# Altium schematic sheet Sheet1.SchDoc (part 3 of 3)
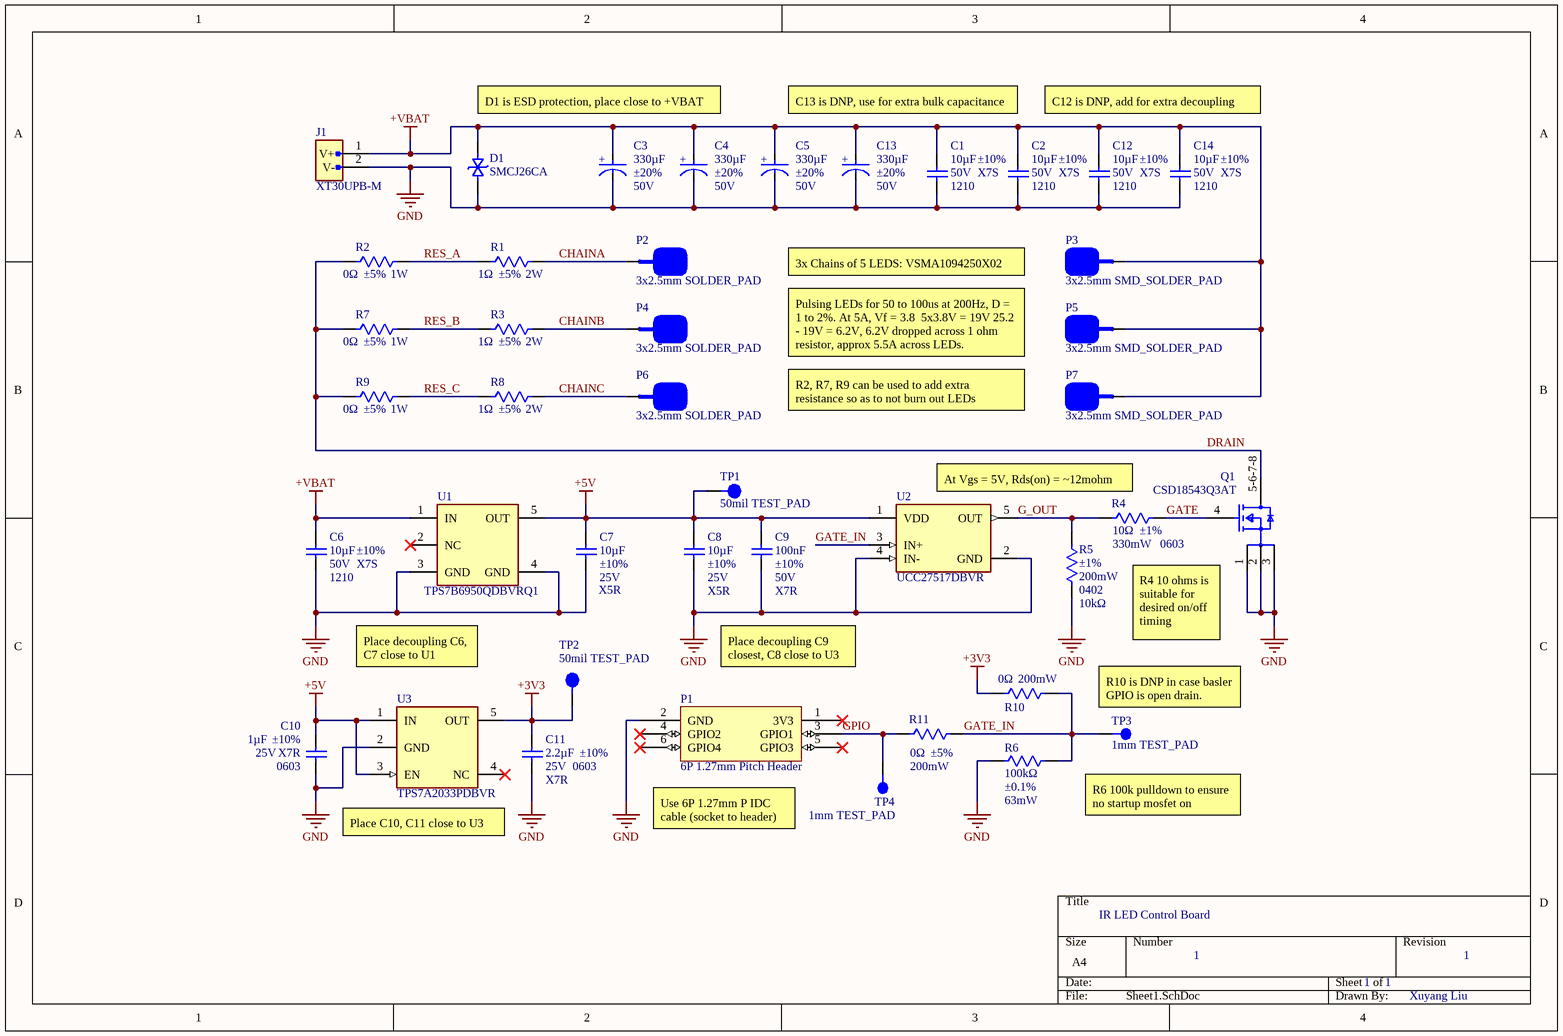
[diagram p2: Sheet1.SchDoc]

## Library data of the parts (continued)
R6 = RT0402BRD07100KL: 100kΩ 62.5mW Thin Film Resistor ±25ppm/℃ ±0.1% 100kΩ 0402 Chip Resistor - Surface Mount ROHS; Manufacturer: Yageo Group; Temperature Coefficient: 25ppm/°C; Voltage Rating: 50V; Manufacturer Part Number: RT0402BRD07100KL; RoHS: Compliant; Category: Chip SMD Resistors; Stock 1: 176013; Pricing 1: 1=0.1, 10=0.078, 25=0.0724, 50=0.0684, 100=0.0646, 250=0.05992, 500=0.05672, 1000=0.05377, 5000=0.04796 (USD); China RoHS: Non-Compliant; Composition: Thin Film; Country of Origin: Mainland China; Depth: 500µm; Export Control Classification Number (ECCN) Code: EAR99; Features: Moisture Resistant; Height: 300µm; Harmonized Tariff Schedule (HTS) Code: 8533.21.00.30; Introduction Date: 2008-06-09; Lead Free: Lead Free; Length: 1mm; Lifecycle Status: Production; Max Operating Temperature: 155°C; Military Standard: Not; Min Operating Temperature: -55°C; Mount: Surface Mount; Number of Terminals: 2; Number of Terminations: 2; Power Rating: 62.5mW; REACH SVHC: Yes; Schedule B: 8533210045, 8533210045|8533210045|8533210045|8533210045|8533210045; Termination: SMD/SMT; Voltage Rating (DC): 50V; Width: 500µm; Working Voltage: 50V; ComponentLink1URL: https://datasheet.octopart.com:443/RT0402BRD07100KL-Yageo-datasheet-176402239.pdf?src-supplier=Future+Electronics; ComponentLink1Description: https://datasheet.octopart.com:443/RT0402BRD07100KL-Yageo-datasheet-176402239.pdf?src-supplier=Future+Electronics; ComponentLink2URL: https://datasheet.octopart.com:443/RT0402BRD07100KL-Yageo-datasheet-169971040.pdf?src-supplier=Future+Electronics; ComponentLink2Description: https://datasheet.octopart.com:443/RT0402BRD07100KL-Yageo-datasheet-169971040.pdf?src-supplier=Future+Electronics; ComponentLink3URL: https://datasheet.octopart.com:443/RT0402BRD07100KL-Yageo-datasheet-166250672.pdf?src-supplier=Future+Electronics; ComponentLink3Description: https://datasheet.octopart.com:443/RT0402BRD07100KL-Yageo-datasheet-166250672.pdf?src-supplier=Future+Electronics; ComponentLink4URL: https://datasheet.octopart.com:443/RT0402BRD07100KL-Yageo-datasheet-136673517.pdf?src-supplier=Future+Electronics; ComponentLink4Description: https://datasheet.octopart.com:443/RT0402BRD07100KL-Yageo-datasheet-136673517.pdf?src-supplier=Future+Electronics; ComponentLink5URL: https://datasheet.octopart.com:443/RT0402BRD07100KL-Yageo-datasheet-137700930.pdf?src-supplier=Future+Electronics; ComponentLink5Description: https://datasheet.octopart.com:443/RT0402BRD07100KL-Yageo-datasheet-137700930.pdf?src-supplier=Future+Electronics; ComponentLink6URL: https://datasheet.octopart.com:443/RT0402BRD07100KL-Yageo-datasheet-41589729.pdf?src-supplier=Future+Electronics; ComponentLink6Description: https://datasheet.octopart.com:443/RT0402BRD07100KL-Yageo-datasheet-41589729.pdf?src-supplier=Future+Electronics; ComponentLink7URL: https://datasheet.octopart.com:443/RT0402BRD07100KL-Yageo-datasheet-12594463.pdf?src-supplier=Future+Electronics; ComponentLink7Description: https://datasheet.octopart.com:443/RT0402BRD07100KL-Yageo-datasheet-12594463.pdf?src-supplier=Future+Electronics; ComponentLink8URL: https://datasheet.octopart.com:443/RT0402BRD07100KL-Yageo-datasheet-10915759.pdf?src-supplier=Future+Electronics; ComponentLink8Description: https://datasheet.octopart.com:443/RT0402BRD07100KL-Yageo-datasheet-10915759.pdf?src-supplier=Future+Electronics; ComponentLink9URL: https://datasheet.octopart.com:443/RT0402BRD07100KL-Yageo-datasheet-34924148.pdf?src-supplier=Future+Electronics; ComponentLink9Description: https://datasheet.octopart.com:443/RT0402BRD07100KL-Yageo-datasheet-34924148.pdf?src-supplier=Future+Electronics; ComponentLink10URL: https://datasheet.octopart.com:443/RT0402BRD07100KL-Yageo-datasheet-96443642.pdf?src-supplier=Upverter; ComponentLink10Description: https://datasheet.octopart.com:443/RT0402BRD07100KL-Yageo-datasheet-96443642.pdf?src-supplier=Upverter; ComponentLink11URL: https://datasheet.octopart.com:443/RT0402BRD07100KL-Yageo-Group-datasheet-188167888.pdf?src-supplier=LCSC; ComponentLink11Description: https://datasheet.octopart.com:443/RT0402BRD07100KL-Yageo-Group-datasheet-188167888.pdf?src-supplier=LCSC; ComponentLink12URL: https://datasheet.octopart.com:443/RT0402BRD07100KL-Yageo-datasheet-164439670.pdf?src-supplier=Newark; ComponentLink12Description: https://datasheet.octopart.com:443/RT0402BRD07100KL-Yageo-datasheet-164439670.pdf?src-supplier=Newark; ComponentLink13URL: https://datasheet.octopart.com:443/RT0402BRD07100KL-Yageo-Group-datasheet-141265893.pdf?src-supplier=ODG+(Origin+Data+Global); ComponentLink13Description: https://datasheet.octopart.com:443/RT0402BRD07100KL-Yageo-Group-datasheet-141265893.pdf?src-supplier=ODG+(Origin+Data+Global); ComponentLink14URL: https://datasheet.octopart.com/RT0402BRD07100KL-Yageo-datasheet-86813807.pdf; ComponentLink14Description: https://datasheet.octopart.com/RT0402BRD07100KL-Yageo-datasheet-86813807.pdf; ComponentLink15URL: http://sigma.octopart.com:80/conflict_mineral_statement/Yageo-company-3.pdf?src-supplier=Compliance+Statements; ComponentLink15Description: http://sigma.octopart.com:80/conflict_mineral_statement/Yageo-company-3.pdf?src-supplier=Compliance+Statements; ComponentLink16URL: http://sigma.octopart.com:80/rohs_statement/Yageo-company-2.pdf?src-supplier=Compliance+Statements; ComponentLink16Description: http://sigma.octopart.com:80/rohs_statement/Yageo-company-2.pdf?src-supplier=Compliance+Statements; Supplier Part Number 1: YAG1343CT-ND; Supplier 1: DigiKey; Case/Package: 0402; Case Code (Imperial): 0402
R10 = RCS04020000Z0ED: 0Ω Resistor, Jumper, 0402 [1005 Metric], Thick Film, 200 mW, 3 A, Surface Mount Device; Manufacturer: Vishay; Max Current Rating: 3A; Voltage Rating: 50V; Tolerance: ±5%; Supplier 1: DigiKey; Manufacturer Part Number: RCS04020000Z0ED; RoHS: Compliant; Category: Chip SMD Resistors; Stock 1: 775160; Pricing 1: 1=0.1, 10=0.032, 25=0.0268, 50=0.0232, 100=0.0204, 250=0.01728, 500=0.01532, 1000=0.01364, 5000=0.01064 (USD); Case Code (Imperial): 0402; Case Code (Metric): 1005; China RoHS: Non-Compliant; Composition: Thick Film; Country of Origin: Israel, Mainland China; Export Control Classification Number (ECCN) Code: EAR99; Features: Automotive AEC-Q200; Height: 350µm; Harmonized Tariff Schedule (HTS) Code: 8533.21.00.30; Introduction Date: 2016-07-12; Length: 1mm; Lifecycle Status: Production; Max Operating Temperature: 155°C; Max Power Dissipation: 200mW; Min Operating Temperature: -55°C; Mount: Surface Mount; Number of Terminals: 2; Number of Terminations: 2; Ratings: AEC-Q200; REACH SVHC: Yes; Voltage Rating (DC): 50V; Width: 500µm; ComponentLink1URL: https://datasheet.octopart.com:443/RCS04020000Z0ED-Vishay-datasheet-176436275.pdf?src-supplier=IHS; ComponentLink1Description: https://datasheet.octopart.com:443/RCS04020000Z0ED-Vishay-datasheet-176436275.pdf?src-supplier=IHS; ComponentLink2URL: https://datasheet.octopart.com:443/RCS04020000Z0ED-Vishay-datasheet-86813749.pdf?src-supplier=Future+Electronics; ComponentLink2Description: https://datasheet.octopart.com:443/RCS04020000Z0ED-Vishay-datasheet-86813749.pdf?src-supplier=Future+Electronics; ComponentLink3URL: http://sigma.octopart.com:80/rohs_statement/Vishay-company-15.pdf?src-supplier=Compliance+Statements; ComponentLink3Description: http://sigma.octopart.com:80/rohs_statement/Vishay-company-15.pdf?src-supplier=Compliance+Statements; Supplier Part Number 1: 541-2877-6-ND; Case/Package: 0402
R11 = RCS04020000Z0ED: 0Ω Resistor, Jumper, 0402 [1005 Metric], Thick Film, 200 mW, 3 A, Surface Mount Device; Manufacturer: Vishay; Max Current Rating: 3A; Voltage Rating: 50V; Supplier 1: DigiKey; Manufacturer Part Number: RCS04020000Z0ED; RoHS: Compliant; Category: Chip SMD Resistors; Stock 1: 775160; Pricing 1: 1=0.1, 10=0.032, 25=0.0268, 50=0.0232, 100=0.0204, 250=0.01728, 500=0.01532, 1000=0.01364, 5000=0.01064 (USD); Case Code (Imperial): 0402; Case Code (Metric): 1005; China RoHS: Non-Compliant; Composition: Thick Film; Country of Origin: Israel, Mainland China; Export Control Classification Number (ECCN) Code: EAR99; Features: Automotive AEC-Q200; Height: 350µm; Harmonized Tariff Schedule (HTS) Code: 8533.21.00.30; Introduction Date: 2016-07-12; Length: 1mm; Lifecycle Status: Production; Max Operating Temperature: 155°C; Max Power Dissipation: 200mW; Min Operating Temperature: -55°C; Mount: Surface Mount; Number of Terminals: 2; Number of Terminations: 2; Ratings: AEC-Q200; REACH SVHC: Yes; Voltage Rating (DC): 50V; Width: 500µm; ComponentLink1URL: https://datasheet.octopart.com:443/RCS04020000Z0ED-Vishay-datasheet-176436275.pdf?src-supplier=IHS; ComponentLink1Description: https://datasheet.octopart.com:443/RCS04020000Z0ED-Vishay-datasheet-176436275.pdf?src-supplier=IHS; ComponentLink2URL: https://datasheet.octopart.com:443/RCS04020000Z0ED-Vishay-datasheet-86813749.pdf?src-supplier=Future+Electronics; ComponentLink2Description: https://datasheet.octopart.com:443/RCS04020000Z0ED-Vishay-datasheet-86813749.pdf?src-supplier=Future+Electronics; ComponentLink3URL: http://sigma.octopart.com:80/rohs_statement/Vishay-company-15.pdf?src-supplier=Compliance+Statements; ComponentLink3Description: http://sigma.octopart.com:80/rohs_statement/Vishay-company-15.pdf?src-supplier=Compliance+Statements; Supplier Part Number 1: 541-2877-6-ND; Case/Package: 0402
U1 = TPS7B6950QDBVRQ1: Automotive 150-mA, off-battery (40-V), high-PSRR, low-IQ, low-dropout voltage regulator; Manufacturer: Texas Instruments; Manufacturer Lifecycle Status: ACTIVE; Accuracy: 3%; Dropout Voltage: 450mV; Max Input Voltage: 40V; Max Junction Temperature (Tj): 150°C; Max Output Current: 150mA; Min Input Voltage: 5.5V; Nominal Supply Current: 15µA; Number of Outputs: 1; Output Type: Fixed; Output Voltage: 5V; Polarity: Positive; Supplier 1: DigiKey; Manufacturer Part Number: TPS7B6950QDBVRQ1; RoHS: Compliant; Category: LDO Voltage Regulators; Stock 1: 19905; Pricing 1: 1=1.27, 10=0.921, 25=0.8336, 100=0.7374, 250=0.69156, 500=0.6639, 1000=0.65178 (USD); Case/Package: SOT-23; Contact Plating: Tin; Height: 1.45mm; Lead Free: Lead Free; Length: 2.9mm; Lifecycle Status: Production; Max Operating Temperature: 125°C; Max Supply Voltage: 40V; Min Current Limit: 150mA; Min Operating Temperature: -40°C; Min Supply Voltage: 5.5V; Mount: Surface Mount; Number of Pins: 5; Number of Regulators: 1; Output Current: 150mA; Packaging: Tape & Reel (TR); Quiescent Current: 15µA; Schedule B: 8542390000; Thickness: 1.2mm; Width: 1.6mm; ComponentLink1URL: https://sigma.octopart.com:443/177332311/technical_drawing/Texas-Instruments-TPS7B6950QDBVRQ1.pdf?src-supplier=Texas+Instruments; ComponentLink1Description: https://sigma.octopart.com:443/177332311/technical_drawing/Texas-Instruments-TPS7B6950QDBVRQ1.pdf?src-supplier=Texas+Instruments; ComponentLink2URL: https://octopart.com:443/opatz8j6/c1?t=yage2jQM-eTAqOBcVFGrEpuvjezUa6ihi7wNyjCuRQGtqUC6dJhCNcRNS_lbs06BocBomxr_74svrzpLGaIERn-qG342R1-BuMQCMBX6cWI06iOToy_eqFmZlCkAcbh1TwQKhIc7V99vdu45YZgRDnkCuEoUv-OSe8c6IG6sPm0a8LlvliNVrX0XJQ9rtL59yZRVpqPT28bvqIjN2DJpQsbikYiQOe84sKG-y_S5m-YDL4KUutxFj13EdM63eCzAJFShkpsQB4Ak1CAByhedHpIePjBP_5H1ppNN2DNL-Xn5Oqs9d5pwb0NkBJzqlrDnQh0A3DSCzOpBQu1JykaSbQbIIYKMbQ8MSCb4hsuaqUoK8UzUCtio1IGXHXVj44cLB37iY0Kfm-Y&src-supplier=Texas+Instruments; ComponentLink2Description: https://octopart.com:443/opatz8j6/c1?t=yage2jQM-eTAqOBcVFGrEpuvjezUa6ihi7wNyjCuRQGtqUC6dJhCNcRNS_lbs06BocBomxr_74svrzpLGaIERn-qG342R1-BuMQCMBX6cWI06iOToy_eqFmZlCkAcbh1TwQKhIc7V99vdu45YZgRDnkCuEoUv-OSe8c6IG6sPm0a8LlvliNVrX0XJQ9rtL59yZRVpqPT28bvqIjN2DJpQsbikYiQOe84sKG-y_S5m-YDL4KUutxFj13EdM63eCzAJFShkpsQB4Ak1CAByhedHpIePjBP_5H1ppNN2DNL-Xn5Oqs9d5pwb0NkBJzqlrDnQh0A3DSCzOpBQu1JykaSbQbIIYKMbQ8MSCb4hsuaqUoK8UzUCtio1IGXHXVj44cLB37iY0Kfm-Y&src-supplier=Texas+Instruments; ComponentLink3URL: https://sigma.octopart.com:443/175570406/technical_drawing/Texas-Instruments-TPS7B6950QDBVRQ1.pdf?src-supplier=Texas+Instruments; ComponentLink3Description: https://sigma.octopart.com:443/175570406/technical_drawing/Texas-Instruments-TPS7B6950QDBVRQ1.pdf?src-supplier=Texas+Instruments; ComponentLink4URL: https://sigma.octopart.com:443/169406034/technical_drawing/Texas-Instruments-TPS7B6950QDBVRQ1.pdf?src-supplier=Texas+Instruments; ComponentLink4Description: https://sigma.octopart.com:443/169406034/technical_drawing/Texas-Instruments-TPS7B6950QDBVRQ1.pdf?src-supplier=Texas+Instruments; ComponentLink5URL: https://sigma.octopart.com:443/155939316/technical_drawing/Texas-Instruments-TPS7B6950QDBVRQ1.pdf?src-supplier=Texas+Instruments; ComponentLink5Description: https://sigma.octopart.com:443/155939316/technical_drawing/Texas-Instruments-TPS7B6950QDBVRQ1.pdf?src-supplier=Texas+Instruments; ComponentLink6URL: https://sigma.octopart.com:443/102331370/technical_drawing/Texas-Instruments-TPS7B6950QDBVRQ1.pdf?src-supplier=Texas+Instruments; ComponentLink6Description: https://sigma.octopart.com:443/102331370/technical_drawing/Texas-Instruments-TPS7B6950QDBVRQ1.pdf?src-supplier=Texas+Instruments; ComponentLink7URL: https://datasheet.octopart.com:443/TPS7B6950QDBVRQ1-Texas-Instruments-datasheet-41218873.pdf?src-supplier=Texas+Instruments; ComponentLink7Description: https://datasheet.octopart.com:443/TPS7B6950QDBVRQ1-Texas-Instruments-datasheet-41218873.pdf?src-supplier=Texas+Instruments; ComponentLink8URL: https://datasheet.octopart.com:443/TPS7B6950QDBVRQ1-Texas-Instruments-datasheet-36993199.pdf?src-supplier=Texas+Instruments; ComponentLink8Description: https://datasheet.octopart.com:443/TPS7B6950QDBVRQ1-Texas-Instruments-datasheet-36993199.pdf?src-supplier=Texas+Instruments; ComponentLink9URL: https://datasheet.octopart.com:443/TPS7B6950QDBVRQ1-Texas-Instruments-datasheet-34152532.pdf?src-supplier=Texas+Instruments; ComponentLink9Description: https://datasheet.octopart.com:443/TPS7B6950QDBVRQ1-Texas-Instruments-datasheet-34152532.pdf?src-supplier=Texas+Instruments; ComponentLink10URL: https://sigma.octopart.com:443/49249325/technical_drawing/Texas-Instruments-TPS7B6950QDBVRQ1.pdf?src-supplier=Texas+Instruments; ComponentLink10Description: https://sigma.octopart.com:443/49249325/technical_drawing/Texas-Instruments-TPS7B6950QDBVRQ1.pdf?src-supplier=Texas+Instruments; ComponentLink11URL: https://datasheet.octopart.com:443/TPS7B6950QDBVRQ1-Texas-Instruments-datasheet-159118311.pdf?src-supplier=Augswan; ComponentLink11Description: https://datasheet.octopart.com:443/TPS7B6950QDBVRQ1-Texas-Instruments-datasheet-159118311.pdf?src-supplier=Augswan; ComponentLink12URL: https://datasheet.octopart.com:443/TPS7B6950QDBVRQ1-Texas-Instruments-datasheet-137316104.pdf?src-supplier=Future+Electronics; ComponentLink12Description: https://datasheet.octopart.com:443/TPS7B6950QDBVRQ1-Texas-Instruments-datasheet-137316104.pdf?src-supplier=Future+Electronics; ComponentLink13URL: http://sigma.octopart.com:80/reach_statement/Texas-Instruments-company-64.pdf?src-supplier=Compliance+Statements; ComponentLink13Description: http://sigma.octopart.com:80/reach_statement/Texas-Instruments-company-64.pdf?src-supplier=Compliance+Statements; ComponentLink14URL: http://sigma.octopart.com:80/conflict_mineral_statement/Texas-Instruments-company-63.pdf?src-supplier=Compliance+Statements; ComponentLink14Description: http://sigma.octopart.com:80/conflict_mineral_statement/Texas-Instruments-company-63.pdf?src-supplier=Compliance+Statements; Supplier Part Number 1: 296-42411-1-ND
U2 = UCC27517DBVR: Texas Instruments 5Pin gate driver module, 20VPower, SOT-23encapsulation; Manufacturer Lifecycle Status: ACTIVE; Channel Type: Single; Fall Time: 7ns; Max Junction Temperature (Tj): 140°C; Max Output Current: 4A; Max Supply Voltage: 18V; Min Supply Voltage: 4.5V; Number of Channels: 1; Operating Supply Voltage: 12V; Propagation Delay: 13ns; Rise Time: 8ns; Turn-On Delay Time: 30ns; Supplier 1: DigiKey; Manufacturer: Texas Instruments; Manufacturer Part Number: UCC27517DBVR; RoHS: Compliant; Category: Gate Drivers; Stock 1: 2734; Pricing 1: 1=0.98, 10=0.701, 25=0.632, 100=0.5563, 250=0.5202, 500=0.4984, 1000=0.48348 (USD); Case/Package: SOT-23; Height: 1.45mm; Lead Free: Lead Free; Length: 2.9mm; Lifecycle Status: Production; Max Operating Temperature: 140°C; Min Operating Temperature: -40°C; Mount: Surface Mount; Number of Drivers: 1; Number of Outputs: 1; Number of Pins: 5; Output Current: 4A; Radiation Hardening: No; Schedule B: 8542390000, 8542390000|8542390000|8542390000|8542390000|8542390000; Thickness: 1.2mm; Width: 1.6mm; ComponentLink1URL: https://sigma.octopart.com:443/177332311/technical_drawing/Texas-Instruments-UCC27517DBVR.pdf?src-supplier=Texas+Instruments; ComponentLink1Description: https://sigma.octopart.com:443/177332311/technical_drawing/Texas-Instruments-UCC27517DBVR.pdf?src-supplier=Texas+Instruments; ComponentLink2URL: https://octopart.com:443/opatz8j6/c1?t=QF-6TnH1_avSJoQ_0S3fiRDidLb9MxGJ4Uz9AwPT0qi1QfR0Fnj5DjTGeeHpbvHs8BjCC_ojhg6WztCpwH9uWHQg9GIa-AzAuCeOFGEbQxNialX3oAXWeuuXjgP1lL4t_JdhfZn_4ivmWfDReC5xef3gN95ASQZer4rTjIvWCu_kxVvyMyJAvfluM_if8tmkY5wKphml2G70Lzp-BMCIWPtYAxyUhprsDNZmykILQtdDZ3Gz1TmTnEk05PTX6KHGZ3jU6-36hwJXdlPG2psy-aBgnEFH6LhDn11bnNEHRcjhEfTTpqi6Xg91J0_YjKJ_VCt2sw1zN9H9homKZKSJklCc6aR8pl7O5AAZ3QjzuuNvD0DZizcwwNxx-IEAlhk7J9HyILY&src-supplier=Texas+Instruments; ComponentLink2Description: https://octopart.com:443/opatz8j6/c1?t=QF-6TnH1_avSJoQ_0S3fiRDidLb9MxGJ4Uz9AwPT0qi1QfR0Fnj5DjTGeeHpbvHs8BjCC_ojhg6WztCpwH9uWHQg9GIa-AzAuCeOFGEbQxNialX3oAXWeuuXjgP1lL4t_JdhfZn_4ivmWfDReC5xef3gN95ASQZer4rTjIvWCu_kxVvyMyJAvfluM_if8tmkY5wKphml2G70Lzp-BMCIWPtYAxyUhprsDNZmykILQtdDZ3Gz1TmTnEk05PTX6KHGZ3jU6-36hwJXdlPG2psy-aBgnEFH6LhDn11bnNEHRcjhEfTTpqi6Xg91J0_YjKJ_VCt2sw1zN9H9homKZKSJklCc6aR8pl7O5AAZ3QjzuuNvD0DZizcwwNxx-IEAlhk7J9HyILY&src-supplier=Texas+Instruments; ComponentLink3URL: https://sigma.octopart.com:443/175570406/technical_drawing/Texas-Instruments-UCC27517DBVR.pdf?src-supplier=Texas+Instruments; ComponentLink3Description: https://sigma.octopart.com:443/175570406/technical_drawing/Texas-Instruments-UCC27517DBVR.pdf?src-supplier=Texas+Instruments; ComponentLink4URL: https://sigma.octopart.com:443/169406034/technical_drawing/Texas-Instruments-UCC27517DBVR.pdf?src-supplier=Texas+Instruments; ComponentLink4Description: https://sigma.octopart.com:443/169406034/technical_drawing/Texas-Instruments-UCC27517DBVR.pdf?src-supplier=Texas+Instruments; ComponentLink5URL: https://sigma.octopart.com:443/155939316/technical_drawing/Texas-Instruments-UCC27517DBVR.pdf?src-supplier=Texas+Instruments; ComponentLink5Description: https://sigma.octopart.com:443/155939316/technical_drawing/Texas-Instruments-UCC27517DBVR.pdf?src-supplier=Texas+Instruments; ComponentLink6URL: https://sigma.octopart.com:443/102331370/technical_drawing/Texas-Instruments-UCC27517DBVR.pdf?src-supplier=Texas+Instruments; ComponentLink6Description: https://sigma.octopart.com:443/102331370/technical_drawing/Texas-Instruments-UCC27517DBVR.pdf?src-supplier=Texas+Instruments; ComponentLink7URL: https://sigma.octopart.com:443/49249325/technical_drawing/Texas-Instruments-UCC27517DBVR.pdf?src-supplier=Texas+Instruments; ComponentLink7Description: https://sigma.octopart.com:443/49249325/technical_drawing/Texas-Instruments-UCC27517DBVR.pdf?src-supplier=Texas+Instruments; ComponentLink8URL: https://datasheet.octopart.com:443/UCC27517DBVR-Texas-Instruments-datasheet-34159947.pdf?src-supplier=Texas+Instruments; ComponentLink8Description: https://datasheet.octopart.com:443/UCC27517DBVR-Texas-Instruments-datasheet-34159947.pdf?src-supplier=Texas+Instruments; ComponentLink9URL: https://datasheet.octopart.com:443/UCC27517DBVR-Texas-Instruments-datasheet-15828057.pdf?src-supplier=Texas+Instruments; ComponentLink9Description: https://datasheet.octopart.com:443/UCC27517DBVR-Texas-Instruments-datasheet-15828057.pdf?src-supplier=Texas+Instruments; ComponentLink10URL: https://datasheet.octopart.com:443/UCC27517DBVR-Texas-Instruments-datasheet-10824616.pdf?src-supplier=Texas+Instruments; ComponentLink10Description: https://datasheet.octopart.com:443/UCC27517DBVR-Texas-Instruments-datasheet-10824616.pdf?src-supplier=Texas+Instruments; ComponentLink11URL: https://datasheet.octopart.com:443/UCC27517DBVR-Texas-Instruments-datasheet-11522356.pdf?src-supplier=Newark; ComponentLink11Description: https://datasheet.octopart.com:443/UCC27517DBVR-Texas-Instruments-datasheet-11522356.pdf?src-supplier=Newark; ComponentLink12URL: https://datasheet.octopart.com:443/UCC27517DBVR-Texas-Instruments-datasheet-10899470.pdf?src-supplier=Arrow+Electronics; ComponentLink12Description: https://datasheet.octopart.com:443/UCC27517DBVR-Texas-Instruments-datasheet-10899470.pdf?src-supplier=Arrow+Electronics; ComponentLink13URL: https://datasheet.octopart.com:443/UCC27517DBVR-Texas-Instruments-datasheet-164421427.pdf?src-supplier=SHENGYU+ELECTRONICS; ComponentLink13Description: https://datasheet.octopart.com:443/UCC27517DBVR-Texas-Instruments-datasheet-164421427.pdf?src-supplier=SHENGYU+ELECTRONICS; ComponentLink14URL: https://datasheet.octopart.com:443/UCC27517DBVR-Texas-Instruments-datasheet-159118422.pdf?src-supplier=LCSC; ComponentLink14Description: https://datasheet.octopart.com:443/UCC27517DBVR-Texas-Instruments-datasheet-159118422.pdf?src-supplier=LCSC; ComponentLink15URL: https://datasheet.octopart.com:443/UCC27517DBVR-Texas-Instruments-datasheet-140572070.pdf?src-supplier=Arrow.cn; ComponentLink15Description: https://datasheet.octopart.com:443/UCC27517DBVR-Texas-Instruments-datasheet-140572070.pdf?src-supplier=Arrow.cn; ComponentLink16URL: http://sigma.octopart.com:80/reach_statement/Texas-Instruments-company-64.pdf?src-supplier=Compliance+Statements; ComponentLink16Description: http://sigma.octopart.com:80/reach_statement/Texas-Instruments-company-64.pdf?src-supplier=Compliance+Statements; ComponentLink17URL: http://sigma.octopart.com:80/conflict_mineral_statement/Texas-Instruments-company-63.pdf?src-supplier=Compliance+Statements; ComponentLink17Description: http://sigma.octopart.com:80/conflict_mineral_statement/Texas-Instruments-company-63.pdf?src-supplier=Compliance+Statements; Supplier Part Number 1: 296-39527-1-ND
U3 = TPS7A2033PDBVR: 300mA ultra-low-noise low-IQ low-dropout (LDO) linear regulator with high PSRR 5-SOT-23 -40 to 125; Manufacturer: Texas Instruments; Manufacturer Lifecycle Status: ACTIVE; Accuracy: 1.5%; Dropout Voltage: 145mV; Max Junction Temperature (Tj): 125°C; Max Supply Voltage: 6V; Min Supply Voltage: 1.6V; Nominal Supply Current: 6.5µA; Number of Channels: 1; Output Voltage: 3.3V; Supplier 1: DigiKey; Manufacturer Part Number: TPS7A2033PDBVR; RoHS: Compliant; Category: LDO Voltage Regulators; Stock 1: 57995; Pricing 1: 1=0.33, 10=0.225, 25=0.1992, 100=0.1715, 250=0.15828, 500=0.15028, 1000=0.14369 (USD); Case/Package: SOT-23-5; Height: 1.45mm; Length: 2.9mm; Lifecycle Status: Production; Max Operating Temperature: 125°C; Min Operating Temperature: -40°C; Number of Outputs: 1; Number of Pins: 5; Output Current: 300mA; Thickness: 1.2mm; Width: 1.6mm; ComponentLink1URL: https://sigma.octopart.com:443/177332311/technical_drawing/Texas-Instruments-TPS7A2033PDBVR.pdf?src-supplier=Texas+Instruments; ComponentLink1Description: https://sigma.octopart.com:443/177332311/technical_drawing/Texas-Instruments-TPS7A2033PDBVR.pdf?src-supplier=Texas+Instruments; ComponentLink2URL: https://octopart.com:443/opatz8j6/c1?t=jI4MJxUHNHWPLUTUjPFE_I4nFT9ogQQS70wFg6iEODFO8LbYHvqBDKPBMlDtEwO4fNGI88ubVwCkCjf0m79oYyvw0lNgXSr_kQlB_nshs-lDL0gpQEt062WpfwVbrY7aMcaNfk_VYcVu1c5ZyMHT8tYLznoJcMs0V3cIKOpV8FkTUbmZxBhaArT7MSQXB5rB175PQ9HeqkODOBcAb5uxQ4pXmdIRVFW0nHjT5bbTxbLCkHYQ6wSbjOTmjpzrmMdRq376bhW5SzS0L0ZYTijf2l1mplZ7KrrI9CUmQvcyMNcVPe6befGlNnr1fDH3Q5Ss6aSm6FD-UpaqOnEuIpR4XaVo6xK0ksEziWk1rzqOuekfSo_fNioOtoDqTgyhaxobMR58zb0N&src-supplier=Texas+Instruments; ComponentLink2Description: https://octopart.com:443/opatz8j6/c1?t=jI4MJxUHNHWPLUTUjPFE_I4nFT9ogQQS70wFg6iEODFO8LbYHvqBDKPBMlDtEwO4fNGI88ubVwCkCjf0m79oYyvw0lNgXSr_kQlB_nshs-lDL0gpQEt062WpfwVbrY7aMcaNfk_VYcVu1c5ZyMHT8tYLznoJcMs0V3cIKOpV8FkTUbmZxBhaArT7MSQXB5rB175PQ9HeqkODOBcAb5uxQ4pXmdIRVFW0nHjT5bbTxbLCkHYQ6wSbjOTmjpzrmMdRq376bhW5SzS0L0ZYTijf2l1mplZ7KrrI9CUmQvcyMNcVPe6befGlNnr1fDH3Q5Ss6aSm6FD-UpaqOnEuIpR4XaVo6xK0ksEziWk1rzqOuekfSo_fNioOtoDqTgyhaxobMR58zb0N&src-supplier=Texas+Instruments; ComponentLink3URL: https://sigma.octopart.com:443/175570406/technical_drawing/Texas-Instruments-TPS7A2033PDBVR.pdf?src-supplier=Texas+Instruments; ComponentLink3Description: https://sigma.octopart.com:443/175570406/technical_drawing/Texas-Instruments-TPS7A2033PDBVR.pdf?src-supplier=Texas+Instruments; ComponentLink4URL: https://sigma.octopart.com:443/169406034/technical_drawing/Texas-Instruments-TPS7A2033PDBVR.pdf?src-supplier=Texas+Instruments; ComponentLink4Description: https://sigma.octopart.com:443/169406034/technical_drawing/Texas-Instruments-TPS7A2033PDBVR.pdf?src-supplier=Texas+Instruments; ComponentLink5URL: https://sigma.octopart.com:443/155939316/technical_drawing/Texas-Instruments-TPS7A2033PDBVR.pdf?src-supplier=Texas+Instruments; ComponentLink5Description: https://sigma.octopart.com:443/155939316/technical_drawing/Texas-Instruments-TPS7A2033PDBVR.pdf?src-supplier=Texas+Instruments; ComponentLink6URL: https://datasheet.octopart.com:443/TPS7A2033PDBVR-Texas-Instruments-datasheet-149070019.pdf?src-supplier=Upverter; ComponentLink6Description: https://datasheet.octopart.com:443/TPS7A2033PDBVR-Texas-Instruments-datasheet-149070019.pdf?src-supplier=Upverter; ComponentLink7URL: https://datasheet.octopart.com:443/TPS7A2033PDBVR-Texas-Instruments-datasheet-164420832.pdf?src-supplier=Augswan; ComponentLink7Description: https://datasheet.octopart.com:443/TPS7A2033PDBVR-Texas-Instruments-datasheet-164420832.pdf?src-supplier=Augswan; ComponentLink8URL: https://datasheet.octopart.com:443/TPS7A2033PDBVR-Texas-Instruments-datasheet-159781690.pdf?src-supplier=LCSC; ComponentLink8Description: https://datasheet.octopart.com:443/TPS7A2033PDBVR-Texas-Instruments-datasheet-159781690.pdf?src-supplier=LCSC; ComponentLink9URL: http://sigma.octopart.com:80/reach_statement/Texas-Instruments-company-64.pdf?src-supplier=Compliance+Statements; ComponentLink9Description: http://sigma.octopart.com:80/reach_statement/Texas-Instruments-company-64.pdf?src-supplier=Compliance+Statements; ComponentLink10URL: http://sigma.octopart.com:80/conflict_mineral_statement/Texas-Instruments-company-63.pdf?src-supplier=Compliance+Statements; ComponentLink10Description: http://sigma.octopart.com:80/conflict_mineral_statement/Texas-Instruments-company-63.pdf?src-supplier=Compliance+Statements; Supplier Part Number 1: 296-TPS7A2033PDBVRDKR-ND